# Altium schematic sheet MPU - DDR.SchDoc
size A4; SheetNumber: 2; SheetTotal: 3
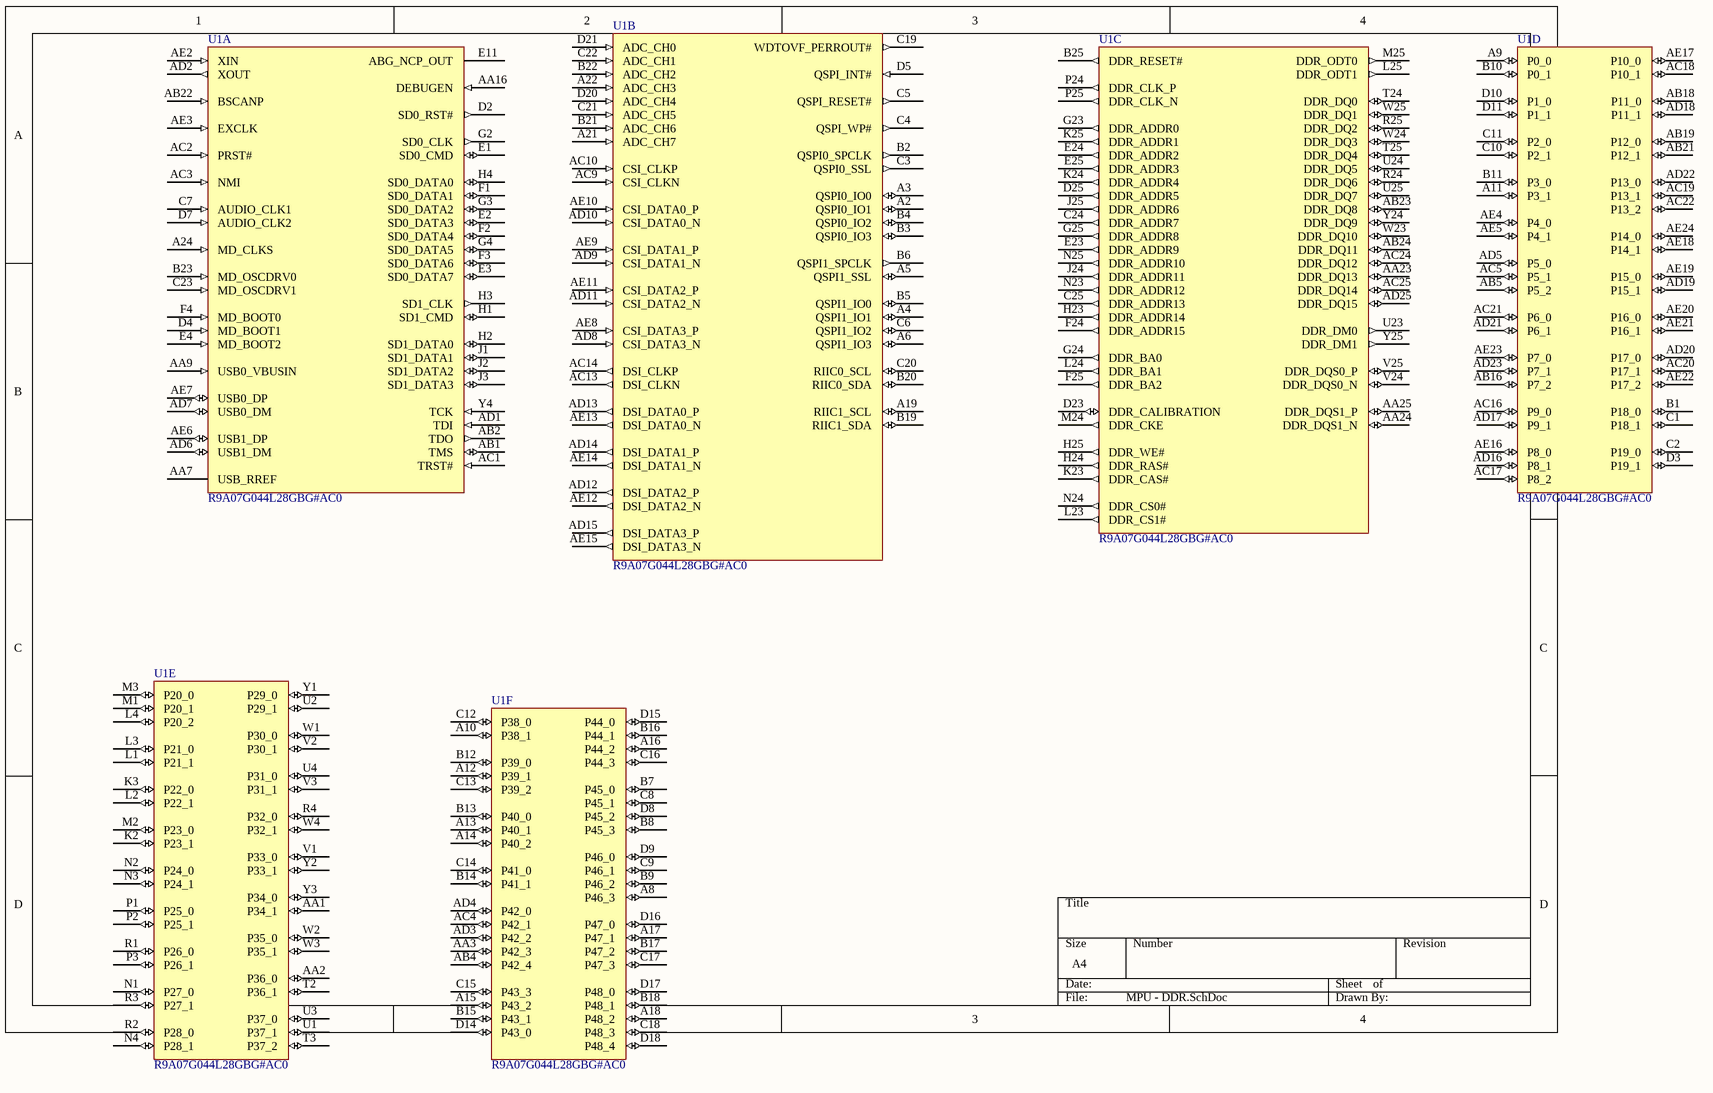
[diagram p0: MPU - DDR.SchDoc]

## Parts
U1  R9A07G044L28GBG#AC0  [R9A07G044L28GBG#AC0]  (parts A,B,C,D,E,F of 11)

## Nets

Not connected (* = marked no-connect by the designer): U1 A2(QSPI0_IO1) A3(QSPI0_IO0) A4(QSPI1_IO1) A5(QSPI1_SSL) A6(QSPI1_IO3) A8(P46_3) A9(P0_0) A10(P38_1) A11(P3_1) A12(P39_1) A13(P40_1) A14(P40_2) A15(P43_2) A16(P44_2) A17(P47_1) A18(P48_2) A19(RIIC1_SCL) A21(ADC_CH7) A22(ADC_CH3) A24(MD_CLKS) AA1(P34_1) AA2(P36_0) AA3(P42_3) AA7(USB_RREF) AA9(USB0_VBUSIN) AA16(DEBUGEN) AA23(DDR_DQ13) AA24(DDR_DQS1_N) AA25(DDR_DQS1_P) AB1(TMS) AB2(TDO) AB4(P42_4) AB5(P5_2) AB16(P7_2) AB18(P11_0) AB19(P12_0) AB21(P12_1) AB22(BSCANP) AB23(DDR_DQ8) AB24(DDR_DQ11) AC1(TRST#) AC2(PRST#) AC3(NMI) AC4(P42_1) AC5(P5_1) AC9(CSI_CLKN) AC10(CSI_CLKP) AC13(DSI_CLKN) AC14(DSI_CLKP) AC16(P9_0) AC17(P8_2) AC18(P10_1) AC19(P13_1) AC20(P17_1) AC21(P6_0) AC22(P13_2) AC24(DDR_DQ12) AC25(DDR_DQ14) AD1(TDI) AD2(XOUT) AD3(P42_2) AD4(P42_0) AD5(P5_0) AD6(USB1_DM) AD7(USB0_DM) AD8(CSI_DATA3_N) AD9(CSI_DATA1_N) AD10(CSI_DATA0_N) AD11(CSI_DATA2_N) AD12(DSI_DATA2_P) AD13(DSI_DATA0_P) AD14(DSI_DATA1_P) AD15(DSI_DATA3_P) AD16(P8_1) AD17(P9_1) AD18(P11_1) AD19(P15_1) AD20(P17_0) AD21(P6_1) AD22(P13_0) AD23(P7_1) AD25(DDR_DQ15) AE2(XIN) AE3(EXCLK) AE4(P4_0) AE5(P4_1) AE6(USB1_DP) AE7(USB0_DP) AE8(CSI_DATA3_P) AE9(CSI_DATA1_P) AE10(CSI_DATA0_P) AE11(CSI_DATA2_P) AE12(DSI_DATA2_N) AE13(DSI_DATA0_N) AE14(DSI_DATA1_N) AE15(DSI_DATA3_N) AE16(P8_0) AE17(P10_0) AE18(P14_1) AE19(P15_0) AE20(P16_0) AE21(P16_1) AE22(P17_2) AE23(P7_0) AE24(P14_0) B1(P18_0) B2(QSPI0_SPCLK) B3(QSPI0_IO3) B4(QSPI0_IO2) B5(QSPI1_IO0) B6(QSPI1_SPCLK) B7(P45_0) B8(P45_3) B9(P46_2) B10(P0_1) B11(P3_0) B12(P39_0) B13(P40_0) B14(P41_1) B15(P43_1) B16(P44_1) B17(P47_2) B18(P48_1) B19(RIIC1_SDA) B20(RIIC0_SDA) B21(ADC_CH6) B22(ADC_CH2) B23(MD_OSCDRV0) B25(DDR_RESET#) C1(P18_1) C2(P19_0) C3(QSPI0_SSL) C4(QSPI_WP#) C5(QSPI_RESET#) C6(QSPI1_IO2) C7(AUDIO_CLK1) C8(P45_1) C9(P46_1) C10(P2_1) C11(P2_0) C12(P38_0) C13(P39_2) C14(P41_0) C15(P43_3) C16(P44_3) C17(P47_3) C18(P48_3) C19(WDTOVF_PERROUT#) C20(RIIC0_SCL) C21(ADC_CH5) C22(ADC_CH1) C23(MD_OSCDRV1) C24(DDR_ADDR7) C25(DDR_ADDR13) D2(SD0_RST#) D3(P19_1) D4(MD_BOOT1) D5(QSPI_INT#) D7(AUDIO_CLK2) D8(P45_2) D9(P46_0) D10(P1_0) D11(P1_1) D14(P43_0) D15(P44_0) D16(P47_0) D17(P48_0) D18(P48_4) D20(ADC_CH4) D21(ADC_CH0) D23(DDR_CALIBRATION) D25(DDR_ADDR5) E1(SD0_CMD) E2(SD0_DATA3) E3(SD0_DATA7) E4(MD_BOOT2) E11(ABG_NCP_OUT) E23(DDR_ADDR9) E24(DDR_ADDR2) E25(DDR_ADDR3) F1(SD0_DATA1) F2(SD0_DATA4) F3(SD0_DATA6) F4(MD_BOOT0) F24(DDR_ADDR15) F25(DDR_BA2) G2(SD0_CLK) G3(SD0_DATA2) G4(SD0_DATA5) G23(DDR_ADDR0) G24(DDR_BA0) G25(DDR_ADDR8) H1(SD1_CMD) H2(SD1_DATA0) H3(SD1_CLK) H4(SD0_DATA0) H23(DDR_ADDR14) H24(DDR_RAS#) H25(DDR_WE#) J1(SD1_DATA1) J2(SD1_DATA2) J3(SD1_DATA3) J24(DDR_ADDR11) J25(DDR_ADDR6) K2(P23_1) K3(P22_0) K23(DDR_CAS#) K24(DDR_ADDR4) K25(DDR_ADDR1) L1(P21_1) L2(P22_1) L3(P21_0) L4(P20_2) L23(DDR_CS1#) L24(DDR_BA1) L25(DDR_ODT1) M1(P20_1) M2(P23_0) M3(P20_0) M24(DDR_CKE) M25(DDR_ODT0) N1(P27_0) N2(P24_0) N3(P24_1) N4(P28_1) N23(DDR_ADDR12) N24(DDR_CS0#) N25(DDR_ADDR10) P1(P25_0) P2(P25_1) P3(P26_1) P24(DDR_CLK_P) P25(DDR_CLK_N) R1(P26_0) R2(P28_0) R3(P27_1) R4(P32_0) R24(DDR_DQ6) R25(DDR_DQ2) T2(P36_1) T3(P37_2) T24(DDR_DQ0) T25(DDR_DQ4) U1(P37_1) U2(P29_1) U3(P37_0) U4(P31_0) U23(DDR_DM0) U24(DDR_DQ5) U25(DDR_DQ7) V1(P33_0) V2(P30_1) V3(P31_1) V24(DDR_DQS0_N) V25(DDR_DQS0_P) W1(P30_0) W2(P35_0) W3(P35_1) W4(P32_1) W23(DDR_DQ10) W24(DDR_DQ3) W25(DDR_DQ1) Y1(P29_0) Y2(P33_1) Y3(P34_0) Y4(TCK) Y24(DDR_DQ9) Y25(DDR_DM1)

## Library data of the parts
U1 = R9A07G044L28GBG#AC0: MPU RZ/G2L ARM Cortex-A55+/ARM Cortex-M33 RISC 64-Bit 1.2GHz 1.8V/3.3V 551-Pin BGA; Manufacturer Lifecycle Status: ACTIVE; Pitch: 800µm; Max Supply Voltage: 3.63V; Min Supply Voltage: 2.97V; RAM Size: 128kB; Number of USB Channels: 2; ComponentLink2Description: Datasheet URL; Mount: Surface Mount; ComponentLink2URL: https://octopart.com/cad-content/api/get-model-datasheet/15189/122020395; Height: 1.4mm; Export Control Classification Number (ECCN) Code: 3A991; Frequency: 1.2GHz; Max Frequency: 1.2GHz; ComponentLink1URL: http://www.renesas.com; Case/Package: BGA; Length: 21mm; Lifecycle Status: Production; ComponentLink3Description: Manufacturer's Package Drawing; Width: 21mm; China RoHS: Compliant; ComponentLink1Description: Manufacturer's Website; HelpURL: https://octopart.com/cad-content/api/get-model-datasheet/15189/122020395; RoHS: Compliant; Number of Pins: 551; ComponentLink3URL: https://www.renesas.com/en/document/psc/package-drawing-lfbga-551pin-plbg0551ga